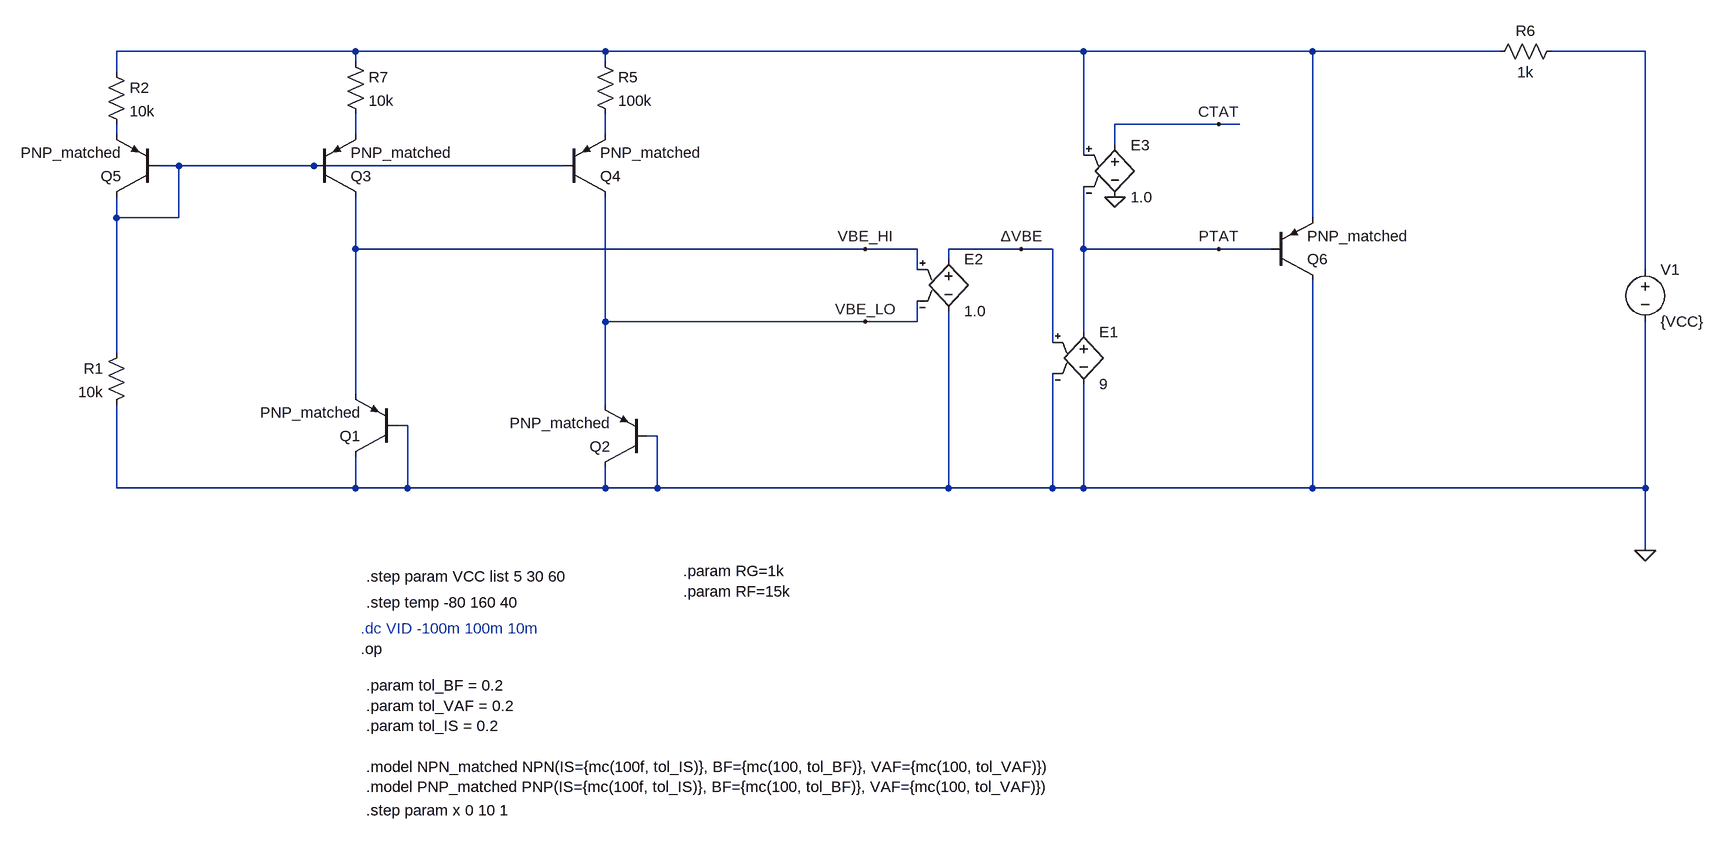
[diagram p0: schematic Shunt_Reference_1p2V_Idealized.asc]
Shunt_Reference_1p2V_Idealized.asc, the LTspice schematic file:
Version 4.1
SHEET 1 2020 1016
WIRE -656 -416 -1024 -416
WIRE -272 -416 -656 -416
WIRE 464 -416 -272 -416
WIRE 816 -416 464 -416
WIRE 1104 -416 816 -416
WIRE 1328 -416 1184 -416
WIRE -656 -400 -656 -416
WIRE -272 -400 -272 -416
WIRE -1024 -384 -1024 -416
WIRE 672 -304 512 -304
WIRE 704 -304 672 -304
WIRE -1024 -288 -1024 -304
WIRE -656 -288 -656 -320
WIRE -272 -288 -272 -320
WIRE 512 -272 512 -304
WIRE 464 -256 464 -416
WIRE -928 -240 -960 -240
WIRE -720 -240 -928 -240
WIRE -336 -240 -720 -240
WIRE -1024 -160 -1024 -192
WIRE -928 -160 -928 -240
WIRE -928 -160 -1024 -160
WIRE 816 -160 816 -416
WIRE -656 -112 -656 -192
WIRE 128 -112 -656 -112
WIRE 208 -112 128 -112
WIRE 368 -112 256 -112
WIRE 416 -112 368 -112
WIRE 464 -112 464 -208
WIRE 672 -112 464 -112
WIRE 752 -112 672 -112
WIRE 256 -96 256 -112
WIRE 208 -80 208 -112
WIRE 1328 -80 1328 -416
WIRE -272 0 -272 -192
WIRE 128 0 -272 0
WIRE 208 0 208 -32
WIRE 208 0 128 0
WIRE 464 16 464 -112
WIRE 416 32 416 -112
WIRE -1024 48 -1024 -160
WIRE -656 112 -656 -112
WIRE -272 128 -272 0
WIRE -576 160 -592 160
WIRE -192 176 -208 176
WIRE -1024 256 -1024 128
WIRE -656 256 -656 208
WIRE -656 256 -1024 256
WIRE -576 256 -576 160
WIRE -576 256 -656 256
WIRE -272 256 -272 224
WIRE -272 256 -576 256
WIRE -192 256 -192 176
WIRE -192 256 -272 256
WIRE 256 256 256 -16
WIRE 256 256 -192 256
WIRE 416 256 416 80
WIRE 416 256 256 256
WIRE 464 256 464 96
WIRE 464 256 416 256
WIRE 816 256 816 -64
WIRE 816 256 464 256
WIRE 1328 256 1328 0
WIRE 1328 256 816 256
WIRE 1328 352 1328 256
FLAG 1328 352 0
FLAG 128 -112 VBE_HI
FLAG 128 0 VBE_LO
FLAG 368 -112 ΔVBE
FLAG 512 -192 0
FLAG 672 -304 CTAT
FLAG 672 -112 PTAT
SYMBOL voltage 1328 -96 R0
WINDOW 123 0 0 Left 0
WINDOW 39 0 0 Left 0
SYMATTR InstName V1
SYMATTR Value {VCC}
SYMBOL res -672 -416 R0
SYMATTR InstName R7
SYMATTR Value 10k
SYMBOL res -288 -416 R0
SYMATTR InstName R5
SYMATTR Value 100k
SYMBOL res 1200 -432 R90
WINDOW 0 0 56 VBottom 2
WINDOW 3 32 56 VTop 2
SYMATTR InstName R6
SYMATTR Value 1k
SYMBOL pnp -592 208 R180
SYMATTR InstName Q1
SYMATTR Value PNP_matched
SYMBOL pnp -208 224 R180
SYMATTR InstName Q2
SYMATTR Value PNP_matched
SYMBOL pnp -960 -192 R180
SYMATTR InstName Q5
SYMATTR Value PNP_matched
SYMBOL res -1008 32 M0
SYMATTR InstName R1
SYMATTR Value 10k
SYMBOL pnp -720 -192 M180
SYMATTR InstName Q3
SYMATTR Value PNP_matched
SYMBOL pnp -336 -192 M180
SYMATTR InstName Q4
SYMATTR Value PNP_matched
SYMBOL res -1040 -400 R0
SYMATTR InstName R2
SYMATTR Value 10k
SYMBOL e 464 0 R0
SYMATTR InstName E1
SYMATTR Value 9
SYMBOL pnp 752 -64 M180
SYMATTR InstName Q6
SYMATTR Value PNP_matched
SYMBOL e 256 -112 R0
SYMATTR InstName E2
SYMATTR Value 1.0
SYMBOL e 512 -288 R0
SYMATTR InstName E3
SYMATTR Value 1.0
TEXT -648 472 Left 2 ;.dc VID -100m 100m 10m
TEXT -640 432 Left 2 !.step temp -80 160 40
TEXT -640 560 Left 2 !.param tol_BF = 0.2\n.param tol_VAF = 0.2\n.param tol_IS = 0.2\n \n.model NPN_matched NPN(IS={mc(100f, tol_IS)}, BF={mc(100, tol_BF)}, VAF={mc(100, tol_VAF)})\n.model PNP_matched PNP(IS={mc(100f, tol_IS)}, BF={mc(100, tol_BF)}, VAF={mc(100, tol_VAF)})
TEXT -640 752 Left 2 !.step param x 0 10 1
TEXT -648 504 Left 2 !.op
TEXT -640 392 Left 2 !.step param VCC list 5 30 60
TEXT -152 384 Left 2 !.param RG=1k\n.param RF=15k

The netlist it stands for:
* Shunt_Reference_1p2V_Idealized.asc
V1 N002 0 {VCC}
R7 N001 N004 10k
R5 N001 N005 100k
R6 N002 N001 1k
Q1 0 0 VBE_HI 0 PNP_matched
Q2 0 0 VBE_LO 0 PNP_matched
Q5 N006 N006 N003 0 PNP_matched
R1 N006 0 10k
Q3 VBE_HI N006 N004 0 PNP_matched
Q4 VBE_LO N006 N005 0 PNP_matched
R2 N001 N003 10k
E1 PTAT 0 ΔVBE 0 9
Q6 0 PTAT N001 0 PNP_matched
E2 ΔVBE 0 VBE_HI VBE_LO 1.0
E3 CTAT 0 N001 PTAT 1.0
.model NPN NPN
.model PNP PNP
.lib standard.bjt
* .dc VID -100m 100m 10m
.step temp -80 160 40
.param tol_BF = 0.2
.param tol_VAF = 0.2
.param tol_IS = 0.2
.model NPN_matched NPN(IS={mc(100f, tol_IS)}, BF={mc(100, tol_BF)}, VAF={mc(100, tol_VAF)})
.model PNP_matched PNP(IS={mc(100f, tol_IS)}, BF={mc(100, tol_BF)}, VAF={mc(100, tol_VAF)})
.step param x 0 10 1
.op
.step param VCC list 5 30 60
.param RG=1k
.param RF=15k
.backanno
.end